# Altium schematic sheet Rectifier.SchDoc
size B; SheetNumber: 4; SheetTotal: 12
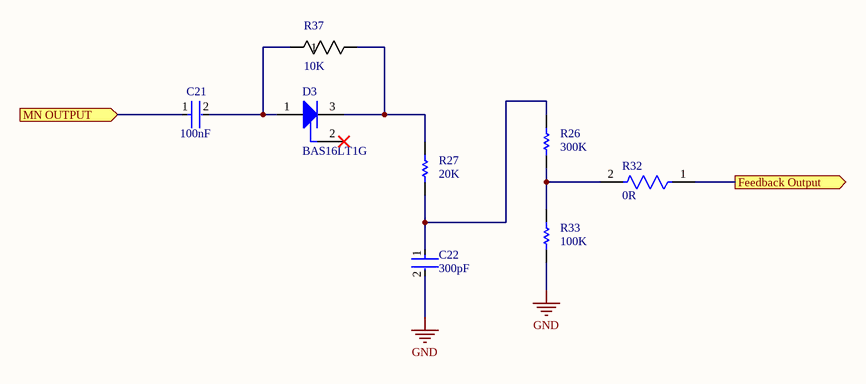
[diagram p0: Rectifier.SchDoc]

## Parts
C21  Capacitance: 100nF  [FP-GRM155-0_05-IPC_C]  (hidden comment: GRM155R62A104KE14D)
C22  value 300pF  [FP-GCM155-0_05-IPC_C]  (hidden comment: GCM1555C1H301FA16J)
D3  BAS16LT1G  [ONSC-SOT-23-3-318-08_V]
R26  value 300K  [RESC1608X55X30ML20T10]  (hidden comment: RK73H1JTTD3003F)
R27  value 20K  [RESC3216X70X40NL20T20]  (hidden comment: SG73P2BTTD2002F)
R32  Resistance: 0R  [FP-RMCF0603-IPC_B]  (hidden comment: RMCF0603ZG0R00)
R33  value 100K  [RESC1608X55X30ML20T10]  (hidden comment: RK73H1JTTD1003F)
R37  value 10K  [BO_CR2512]  (hidden comment: CRM2512-JW-103ELF)

## Ports
Feedback Output (out), MN OUTPUT (in)

## Nets
GND: C22.2 R33.1
Feedback Output: R32.1 ; port Feedback Output
MN OUTPUT: C21.1 ; port MN OUTPUT
NetC21_2: C21.2 D3.1(A) R37.1
NetC22_1: C22.1 R26.2 R27.1
NetD3_3: D3.3(K) R27.2 R37.2
NetR26_1: R26.1 R32.2 R33.2

Not connected (* = marked no-connect by the designer): D3 2(NC)*

## Library data of the parts
C21 = CMP-06035-008289-1: Chip Multilayer Ceramic Capacitors for General Purpose, 0402, 0.10uF, X5R, 15%, 10%, 100V; Case Code (Metric): 1005; Width: 0.5mm; Case/Package: 0402; Case Code (Imperial): 0402; Voltage Rating (DC): 100V; Package Quantity: 10000; Length: 0.039inch; Height: 0.5mm; Max Operating Temperature: 85°C; Lead Free: Lead Free; Termination: SMD/SMT; Mount: Surface Mount; Tolerance: 10%; Packaging: Tape and Reel; Voltage Rating: 100V; Thickness: 0.022inch; Dielectric: X5R; REACH SVHC: No SVHC; Min Operating Temperature: -55°C; Weight: 0.000212oz
C22 = CMP-06035-012343-1: Ceramic Capacitor for Automotive 300pF ±1% 50VDC C0G 0402 Paper T/R
D3 = CMP-1054-00156-1: Switching Diode, 3-Pin SOT-23, Pb-Free, Tape and Reel; Manufacturer: On Semiconductor; trr Max (ns): 6; IF Max (A): 0.2; Configuration: Single; PackageVersion: Rev. AP, 11/2009; ComponentLink1Description: Manufacturer URL; ComponentLink2Description: Datasheet; Mounting Technology: Surface Mount; PartNumber: BAS16LT1G; ComponentLink3URL: http://www.onsemi.cn/pub_link/Collateral/318-08.PDF; ComponentLink3Description: Package Specification; PackageReference: SOT-23-3-318-08; DatasheetVersion: Rev. 10; ComponentLink1URL: http://www.onsemi.com/; PackageDescription: 3-Pin Small Outline Transistor, Body 2.92 x 1.3 mm, Pitch 0.95 mm; ComponentLink2URL: http://www.onsemi.com/pub_link/Collateral/BAS16LT1-D.PDF; Packing: Tape and Reel; RoHS: TRUE
R26 = CMP-2000-01399-1: Manufacturer: KOA Speer; Part Number: RK73H1JTTD3003F
R27 = CMP-2003-01671-1: Manufacturer: KOA Speer; Part Number: SG73P2BTTD2002F
R32 = CMP-26527-006412-1: 0Ω ±0 0.1W 0603 Thick Film Chip Resistor AEC-Q200 compliant; Max Power Dissipation: 100mW; Width: 0.031inch; RoHS Compliant: Yes; Number of Terminations: 2; Case/Package: 0603; Contact Plating: Tin; Height: 0.022inch; Resistor Type: Thick Film; Mount: Surface Mount; Length: 0.061inch; Features: Automotive AEC-Q200; Series: RMCF; Max Operating Temperature: 155°C; Radiation Hardening: No; Min Operating Temperature: -55°C; Packaging: Tape and Reel
R33 = CMP-2000-01100-1: Manufacturer: KOA Speer; Part Number: RK73H1JTTD1003F
R37 = CRM2512-JW-103ELF: 10K 2W; Manufacturer_Name: Bourns Electronics; Copyright: Copyright (C) 2026 Ultra Librarian. All rights reserved.; Manufacturer_Part_Number: CRM2512-JW-103ELF